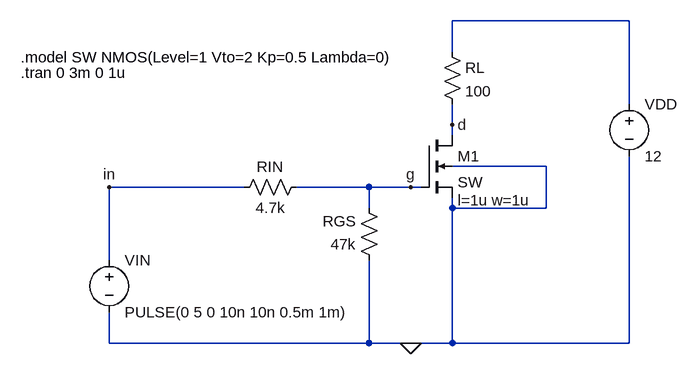
[diagram p0: schematic Ex08.asc]
Ex08.asc, the LTspice schematic file:
Version 4.1
SHEET 1 880 680
WIRE 512 -176 240 -176
WIRE 240 -128 240 -176
WIRE 512 -48 512 -176
WIRE 240 -16 240 -48
WIRE 240 0 240 -16
WIRE 384 48 240 48
WIRE -80 80 -288 80
WIRE 112 80 0 80
WIRE 176 80 112 80
WIRE 192 80 176 80
WIRE 112 112 112 80
WIRE 240 112 240 96
WIRE 384 112 384 48
WIRE 384 112 240 112
WIRE -288 192 -288 80
WIRE -288 320 -288 272
WIRE 112 320 112 192
WIRE 112 320 -288 320
WIRE 176 320 112 320
WIRE 240 320 240 112
WIRE 240 320 176 320
WIRE 512 320 512 32
WIRE 512 320 240 320
FLAG 176 320 0
FLAG -288 80 in
FLAG 176 80 g
FLAG 240 -16 d
SYMBOL nmos4 192 0 R0
WINDOW 39 56 100 Left 2
SYMATTR SpiceLine l=1u w=1u
SYMATTR InstName M1
SYMATTR Value SW
SYMBOL res 128 208 R180
WINDOW 0 36 76 Left 2
WINDOW 3 36 40 Left 2
SYMATTR InstName RGS
SYMATTR Value 47k
SYMBOL res 16 64 R90
WINDOW 0 0 56 VBottom 2
WINDOW 3 32 56 VTop 2
SYMATTR InstName RIN
SYMATTR Value 4.7k
SYMBOL res 224 -144 R0
SYMATTR InstName RL
SYMATTR Value 100
SYMBOL voltage 512 -64 R0
SYMATTR InstName VDD
SYMATTR Value 12
SYMBOL voltage -288 176 R0
WINDOW 123 0 0 Left 0
WINDOW 39 0 0 Left 0
SYMATTR InstName VIN
SYMATTR Value PULSE(0 5 0 10n 10n 0.5m 1m)
TEXT -424 -120 Left 2 !.model SW NMOS(Level=1 Vto=2 Kp=0.5 Lambda=0)
TEXT -424 -96 Left 2 !.tran 0 3m 0 1u

The netlist it stands for:
* Ex08.asc
M1 d g 0 0 SW l=1u w=1u
RGS 0 g 47k
RIN g in 4.7k
RL N001 d 100
VDD N001 0 12
VIN in 0 PULSE(0 5 0 10n 10n 0.5m 1m)
.model NMOS NMOS
.model PMOS PMOS
.lib standard.mos
.model SW NMOS(Level=1 Vto=2 Kp=0.5 Lambda=0)
.tran 0 3m 0 1u
.backanno
.end